# Altium schematic sheet 1原理图.SchDoc
size A3
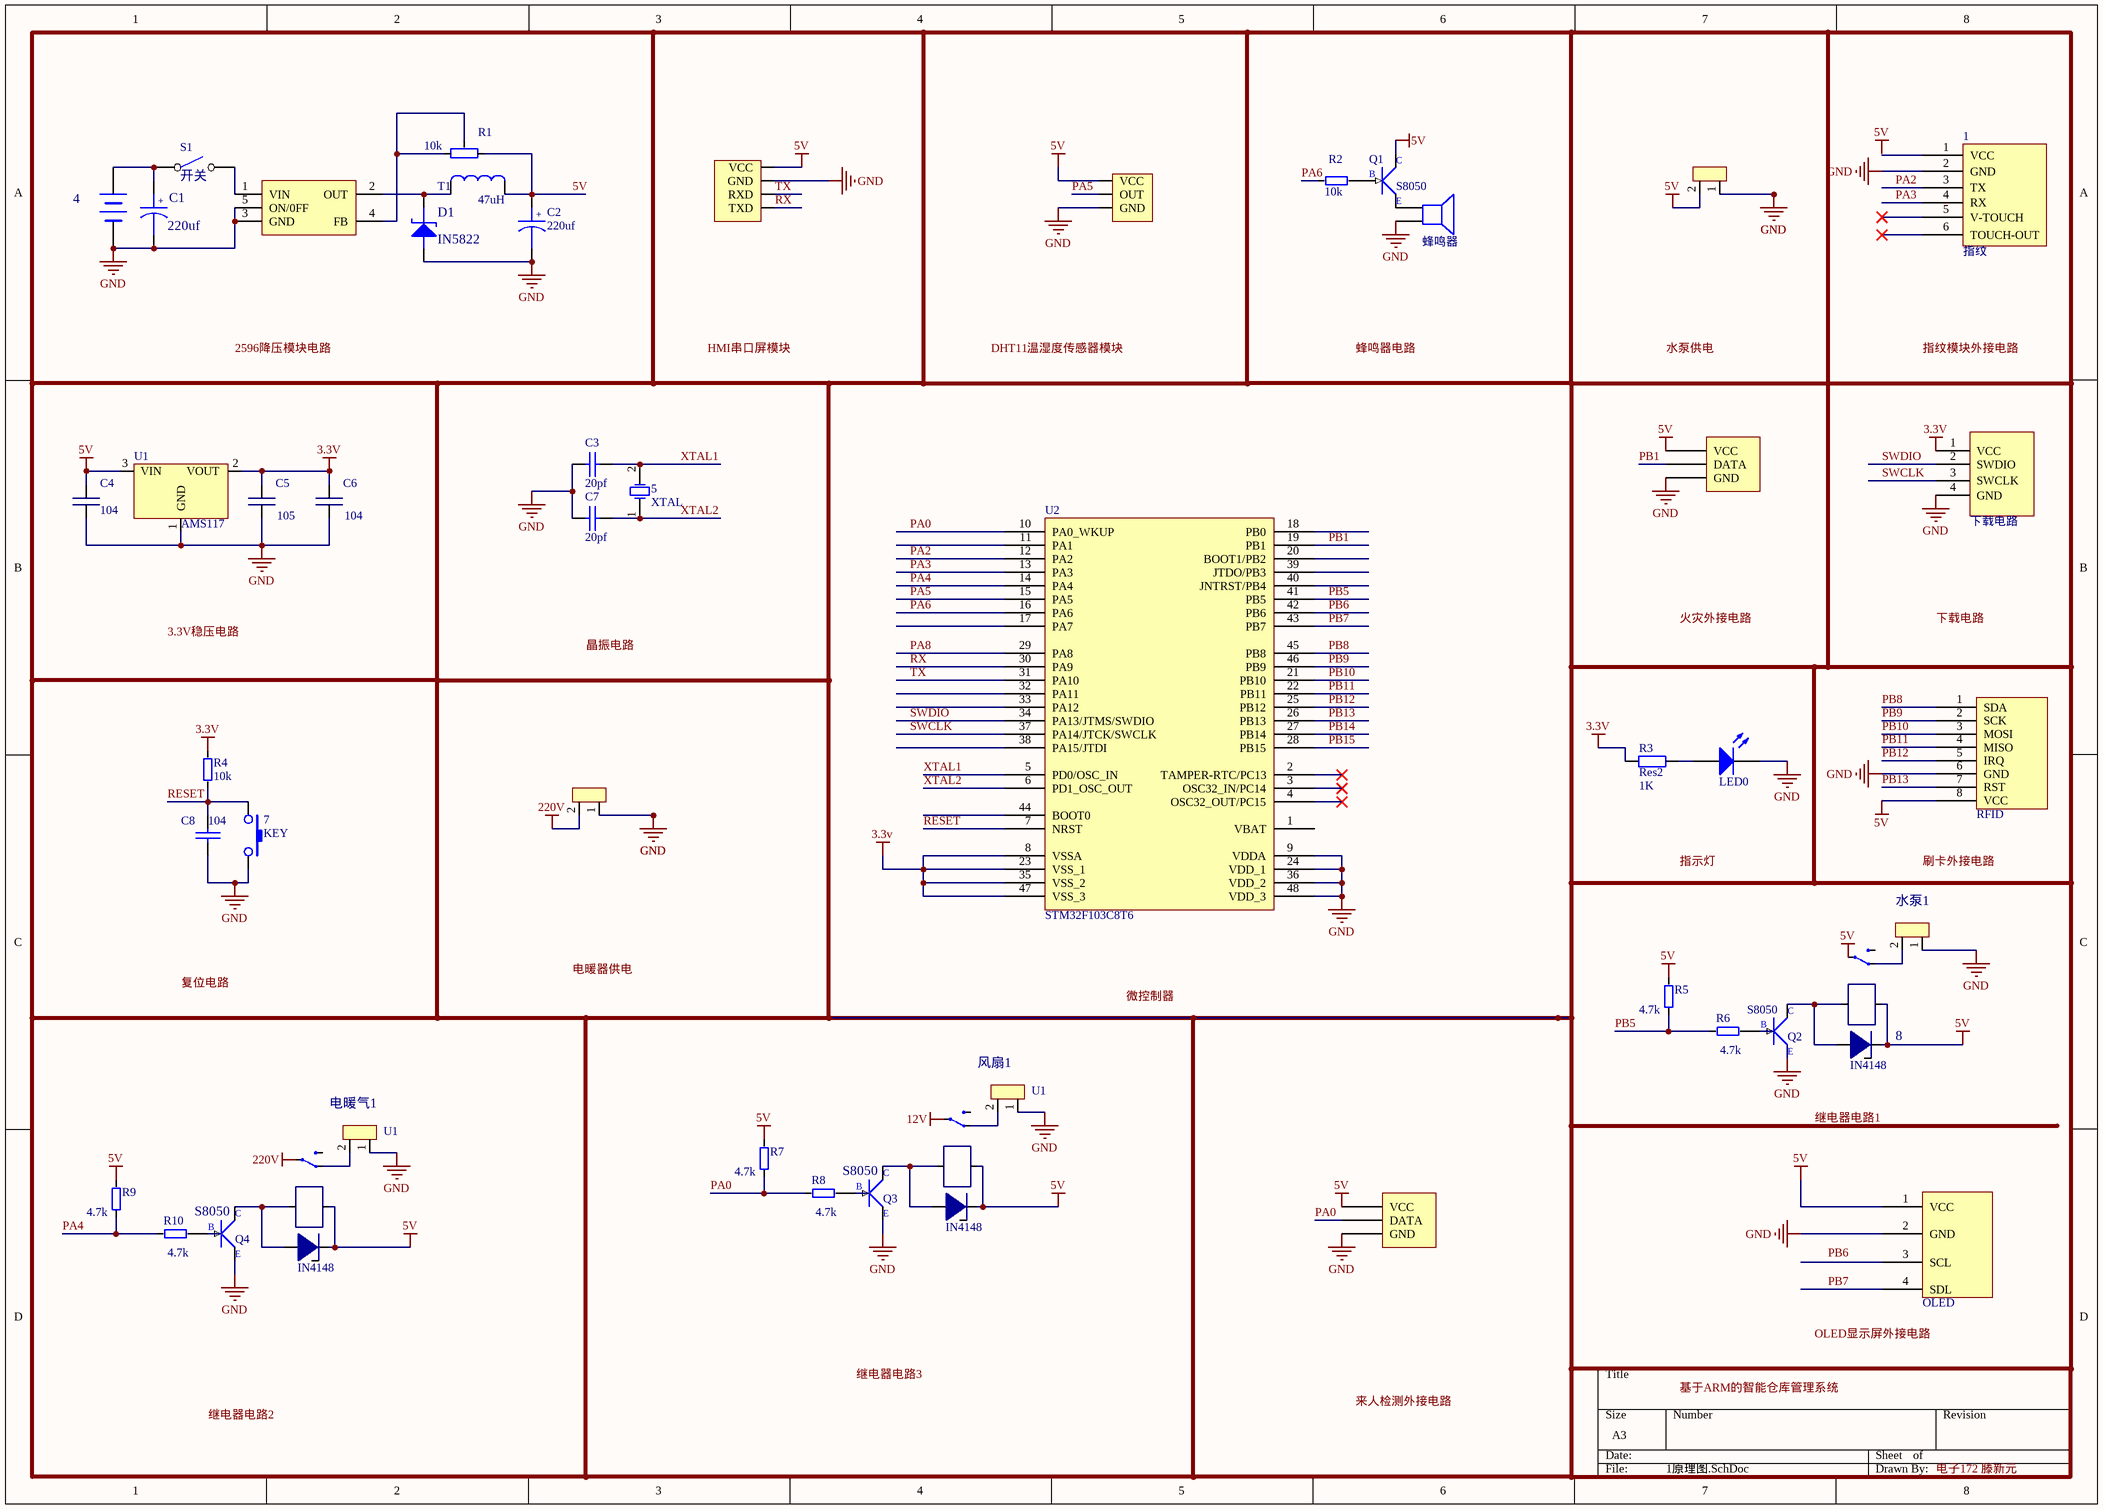
[diagram p0: 1原理图.SchDoc]

## Parts
1  指纹
2  CON2  (value not drawn)
3  2596降压模块  [8-8LED点阵 - duplicate]  (value not drawn)
4  BATTERY  (value not drawn)
5  XTAL  [XTAL]
6  CON2  (value not drawn)
7  KEY
8  继电器  (value not drawn)
9  OLED
*1  CON2_1  (value not drawn)
*2  hc12  (value not drawn)
*3  下载电路
*4  DS18B20  (value not drawn)
*5  RFID
*6  IN4148  [0805_LED_1]
*7  IN4148  [0805_LED_1]
*8  DS18B20  (value not drawn)
*9  IN4148  [0805_LED_1]
C1  220uf
C2  220uf
C3  20pf  [RAD0.1]
C4  104  [0805-RES-CAP]
C5  105  [0805-RES-CAP]
C6  104  [0805-RES-CAP]
C7  20pf  [RAD0.1]
C8  104  [RAD0.1]
D1  IN5822
D2  LED0  [LED-0]
Q1  S8050
Q2  S8050
Q3  S8050
Q4  S8050
R1  10k  [VR]
R2  10k  [R标准]
R3  Res2  value 1K  [AXIAL-0.4]
R4  10k  [R标准]
R5  4.7k  [R标准]
R6  4.7k  [R标准]
R7  4.7k  [R标准]
R8  4.7k  [R标准]
R9  4.7k  [R标准]
R10  4.7k  [R标准]
S1  开关
T1  47uH
U1  AMS117  [SOT-223]
U2  STM32F103C8T6
水泵1  CON2  (value not drawn)
电暖气1  U1
继电器1  继电器  (value not drawn)
继电器2  继电器  (value not drawn)
蜂鸣器1  蜂鸣器
风扇1  U1

## Nets
3.3V: *3.1(VCC) C5.2 C6.2 R3.1 R4.2 U1.2(VOUT) U2.8(VSSA) U2.23(VSS_1) U2.35(VSS_2) U2.47(VSS_3)
5V: 2.2 8.1 9.1(VCC) *1.1(VCC) *2.1(VCC) *4.54(VCC) *5.8(VCC) *6.2 *7.2 *8.54(VCC) *9.2 C2.1 C4.2 Q1.2 R1.1 R5.2 R7.2 R9.2 T1.3 U1.3(VIN) 继电器1.1 继电器2.1
12V: 继电器1.1
220V: 6.2 继电器2.1
GND: 1.2(GND) 2.1 3.3(GND) 3.5(ON/0FF) 4.2(-) 6.1 7.2 9.2(GND) *1.3(GND) *2.1(GND) *3.4(GND) *4.?2(GND) *5.6(GND) *8.?2(GND) C1.2 C2.2 C3.1 C4.1 C5.1 C6.1 C7.2 C8.2 D1.1(A) D2.2(K) Q2.3 U1.1(GND) U2.9(VDDA) U2.24(VDD_1) U2.36(VDD_2) U2.48(VDD_3) 水泵1.1 电暖气1.1 蜂鸣器1.2 风扇1.1
PA0: *8.?1(DATA) R7.1 R8.1 U2.10(PA0_WKUP)
PA2: 1.3(TX) U2.12(PA2)
PA3: 1.4(RX) U2.13(PA3)
PA4: R9.1 R10.1 U2.14(PA4)
PA5: *1.2(OUT) U2.15(PA5)
PA6: R2.1 U2.16(PA6)
PA8: U2.29(PA8)
PB1: *4.?1(DATA) U2.19(PB1)
PB5: R5.1 R6.1 U2.41(PB5)
PB6: U2.42(PB6)
PB7: 9.4(SDL) U2.43(PB7)
PB8: *5.1(SDA) U2.45(PB8)
PB9: *5.2(SCK) U2.46(PB9)
PB10: *5.3(MOSI) U2.21(PB10)
PB11: *5.4(MISO) U2.22(PB11)
PB12: *5.5(IRQ) U2.25(PB12)
PB13: *5.7(RST) U2.26(PB13)
PB14: U2.27(PB14)
PB15: U2.28(PB15)
RESET: 7.1 C8.1 R4.1 U2.7(NRST)
RX: *2.3(TXD) U2.30(PA9)
SWCLK: *3.3(SWCLK) U2.37(PA14/JTCK/SWCLK)
SWDIO: *3.2(SWDIO) U2.34(PA13/JTMS/SWDIO)
TX: *2.2(RXD) U2.31(PA10)
XTAL1: 5.2 C3.2 U2.5(PD0/OSC_IN)
XTAL2: 5.1 C7.1 U2.6(PD1_OSC_OUT)
Net3_1: 3.1(VIN) S1.2
Net3_2: 3.2(OUT) D1.2(K) T1.1
Net3_4: 3.4(FB) R1.2 R1.3
Net4_1: 4.1(+) C1.1 S1.1
Net8_1: 8.1 *6.1 Q2.2
Net8_1: 8.1 水泵1.2  [a separate net that carries the same name]
Net*7_1: *7.1 Q3.2 继电器1.1
Net*9_1: *9.1 Q4.2 继电器2.1
NetD2_1: D2.1(A) R3.2
NetQ1_1: Q1.1(G) R2.2
NetQ2_1: Q2.1(G) R6.2
NetQ3_1: Q3.1(G) R8.2
NetQ4_1: Q4.1(G) R10.2
Net电暖气1_2: 电暖气1.2 继电器2.1
Net继电器1_1: 继电器1.1 风扇1.2

Not connected (* = marked no-connect by the designer): 1 1(VCC) 5(V-TOUCH)* 6(TOUCH-OUT)*; 9 3(SCL); Q1 3; Q3 3; Q4 3; U2 1(VBAT) 2(TAMPER-RTC/PC13)* 3(OSC32_IN/PC14)* 4(OSC32_OUT/PC15)* 11(PA1) 17(PA7) 18(PB0) 20(BOOT1/PB2) 32(PA11) 33(PA12) 38(PA15/JTDI) 39(JTDO/PB3) 40(JNTRST/PB4) 44(BOOT0); 蜂鸣器1 1

## Notes on the sheet
- Labels drawn without touching a wire or pin: 3.3V稳压电路, 5V, 2596降压模块电路, DHT11温湿度传感器模块, HMI串口屏模块, OLED显示屏外接电路, PB6, 下载电路, 刷卡外接电路, 基于ARM的智能仓库管理系统, 复位电路, 微控制器, 指示灯, 指纹模块外接电路, 晶振电路, 来人检测外接电路, 水泵供电, 火灾外接电路, 电暖器供电, 继电器电路2, 继电器电路3, 蜂鸣器电路
- (in symbol S8050) C; B; E
- (in symbol 电解电容) +

## Library data of the parts
3 = 2596降压模块: 8-8: RAD
5 = XTAL: XTAL: 12MHZ
9 = 四个引脚口
*6 *7 *9 = LED
C1 C2 = 电解电容: Capacitor
C3 C7 C8 = 普通电容: Capacitor
C4-C6 = CAP
D1 = ZENER2: Zener Diode
D2 = LED0: Typical INFRARED GaAs LED; Published: 8-Jun-2000; LatestRevisionDate: 08-Jul-2005; LatestRevisionNote: Mech Layer 1 removed.; PackageReference: LED-0; Publisher: Altium Limited; PackageDescription: LED; 2 Leads
R1 = 可调电阻: Potentiometer
R2 R4-R10 = RES
R3 = Res2: Resistor; Published: 8-Jun-2000; LatestRevisionDate: 17-Jul-2002; LatestRevisionNote: Re-released for DXP Platform.; PackageReference: AXIAL-0.4; Publisher: Altium Limited; PackageDescription: Axial Device, Thru-Hole; 2 Leads; 0.4 in Pin Spacing
S1 = 单刀开关
T1 = TRANS3_1
U1 = LM1117-3.3_1
电暖气1 风扇1 = CON2